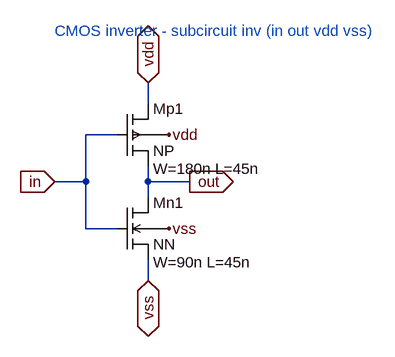
[diagram p0: schematic inv.asc]
inv.asc, the LTspice schematic file:
Version 4
SHEET 1 1100 800
TEXT 64 -16 Left 2 ;CMOS inverter - subcircuit inv (in out vdd vss)
SYMBOL mp 160 96 R0
SYMATTR InstName Mp1
SYMATTR Value NP
SYMATTR SpiceLine W=180n L=45n
SYMBOL mn 160 240 R0
SYMATTR InstName Mn1
SYMATTR Value NN
SYMATTR SpiceLine W=90n L=45n
WIRE 208 96 208 64
FLAG 208 64 vdd
IOPIN 208 64 BiDir
FLAG 240 144 vdd
WIRE 208 192 208 216
WIRE 208 216 208 240
WIRE 208 216 272 216
FLAG 272 216 out
IOPIN 272 216 Out
WIRE 160 144 112 144
WIRE 112 144 112 216
WIRE 112 216 112 288
WIRE 112 288 160 288
WIRE 112 216 64 216
FLAG 64 216 in
IOPIN 64 216 In
FLAG 240 288 vss
WIRE 208 336 208 368
FLAG 208 368 vss
IOPIN 208 368 BiDir

The netlist it stands for:
* inv.asc
Mp1 out in vdd vdd NP W=180n L=45n
Mn1 out in vss vss NN W=90n L=45n
.model NMOS NMOS
.model PMOS PMOS
.lib standard.mos
* CMOS inverter - subcircuit inv (in out vdd vss)
.backanno
.end